# Altium schematic sheet 200_DC-DC.SchDoc: DC-DC Convertion stage
size A4; Date: xxxxxx; DrawnBy: J.A.Oviedo; Revision: R1V1; SheetNumber: 3; SheetTotal: 5
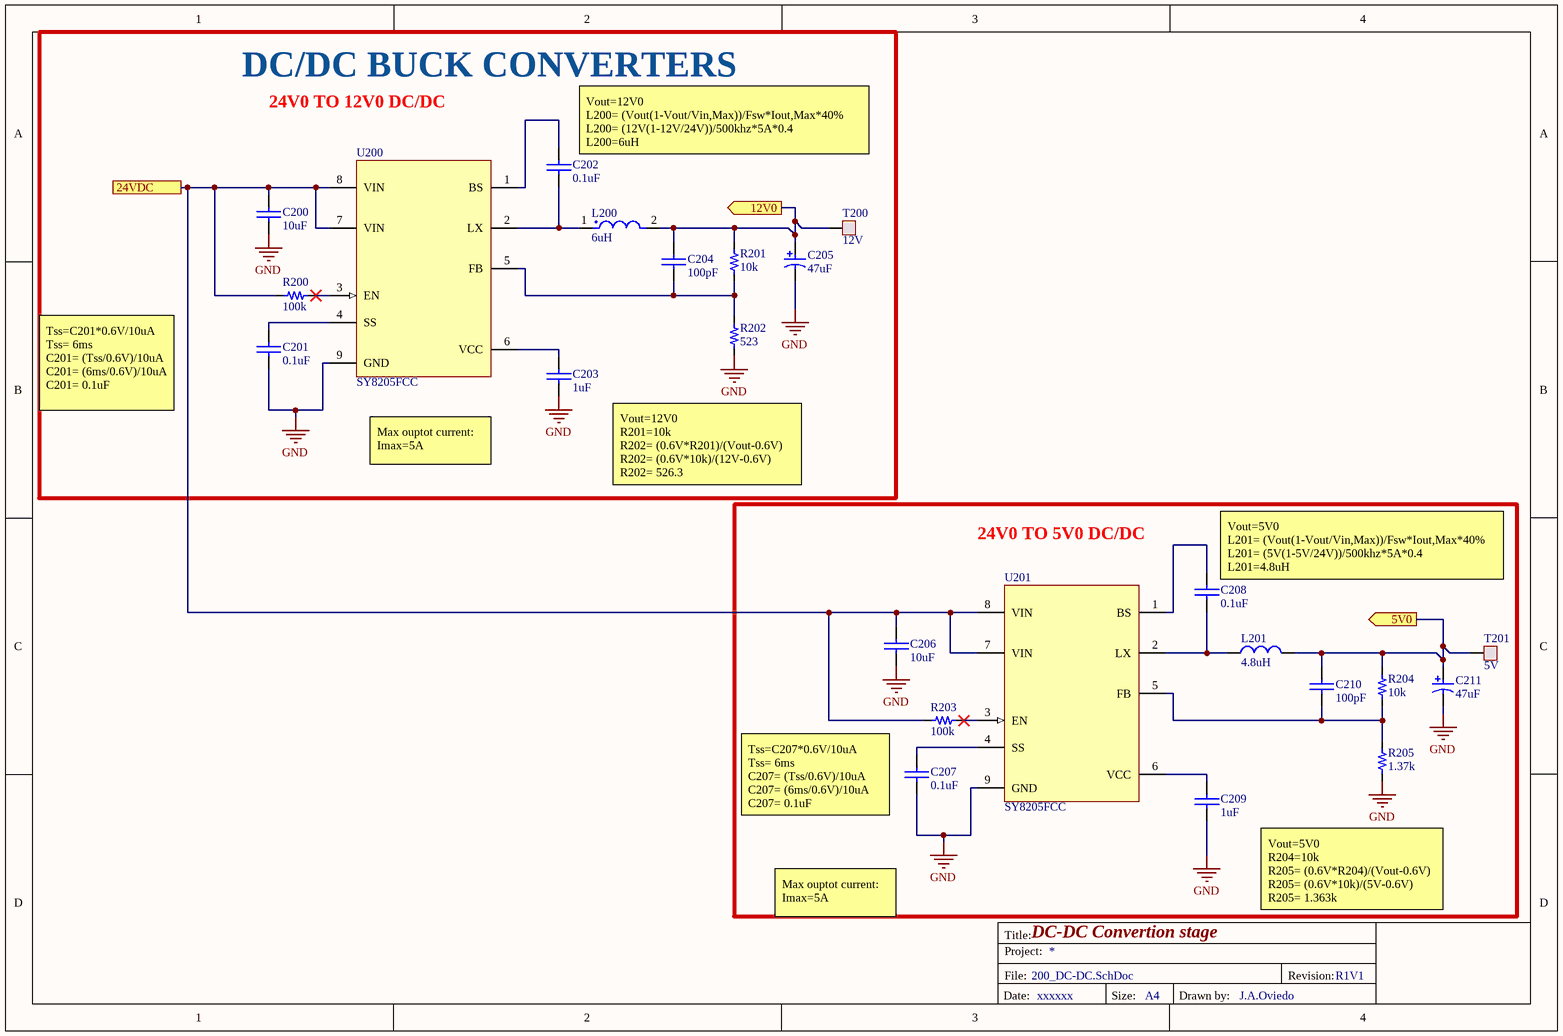
[diagram p0: 200_DC-DC.SchDoc]

## Parts
C200  value 10uF  [1206]  (hidden comment: 10uF 50V)
C201  value 0.1uF  [0603]  (hidden comment: 0.1uF 50V)
C202  value 0.1uF  [0603]  (hidden comment: 0.1uF 50V)
C203  value 1uF  [0805]  (hidden comment: 1uF 25V)
C204  value 100pF  [0201]  (hidden comment: 100pF 25V)
C205  value 47uF  [RADIAL-CAN_LSx2.54mm_Diax6.35mm]  (hidden comment: 47uF 25V)
C206  value 10uF  [1206]  (hidden comment: 10uF 50V)
C207  value 0.1uF  [0603]  (hidden comment: 0.1uF 50V)
C208  value 0.1uF  [0603]  (hidden comment: 0.1uF 50V)
C209  value 1uF  [0805]  (hidden comment: 1uF 25V)
C210  value 100pF  [0201]  (hidden comment: 100pF 25V)
C211  value 47uF  [RADIAL-CAN_LSx2.54mm_Diax6.35mm]  (hidden comment: 47uF 25V)
L200  value 6uH  [L_6uH_9.4A_CSCM1256]  (hidden comment: CSCM1256-6R0M)
L201  value 4.8uH  [L_4.8uH_11A_1312]  (hidden comment: 4.8uH_11A)
R200  value 100k  [0603]  (hidden comment: 100k 1/10W)
R201  value 10k  [0603]  (hidden comment: 10k 1/10W)
R202  value 523  [Res_523_0603_0.1W]  (hidden comment: 523_0.1W)
R203  value 100k  [0603]  (hidden comment: 100k 1/10W)
R204  value 10k  [0603]  (hidden comment: 10k 1/10W)
R205  value 1.37k  [Res_1.37k_0603_0.1W]  (hidden comment: 1.37k_0.1W)
T200  12V  [TP_SMD_45mil]  (no BOM)
T201  5V  [TP_SMD_45mil]  (no BOM)
U200  SY8205FCC  [SOIC127P600X160_HS-9N]
U201  SY8205FCC  [SOIC127P600X160_HS-9N]

## Blocks framed on the sheet
DC/DC BUCK CONVERTERS: C200-C205 L200 R200-R202 T200 U200
24V0 TO 5V0 DC/DC: C206-C211 L201 R203-R205 T201 U201

## Ports
5V0 (out, see 000_Hierarchical[4B], 400_DC-DC_Part3[3B]), 12V0 (out, see 000_Hierarchical[4A]), 24VDC (see 000_Hierarchical[3B], 100_AC-DC[4B], 300_DC-DC_Part2[1A], 400_DC-DC_Part3[1B])

## Nets
GND: C200.2 C201.2 C203.2 C205.2 C206.2 C207.2 C209.2 C211.2 R202.2 R205.1 U200.9(GND) U201.9(GND)
5V0: C210.1 C211.1 L201.2 R204.2 T201.1 ; port 5V0
12V0: C204.1 C205.1 L200.2 R201.2 T200.1 ; port 12V0
24VDC: C200.1 C206.1 R200.1 R203.1 U200.7(VIN) U200.8(VIN) U201.7(VIN) U201.8(VIN) ; port 24VDC
NetC201_1: C201.1 U200.4(SS)
NetC202_1: C202.1 U200.1(BS)
NetC202_2: C202.2 L200.1 U200.2(LX)
NetC203_1: C203.1 U200.6(VCC)
NetC204_2: C204.2 R201.1 R202.1 U200.5(FB)
NetC207_1: C207.1 U201.4(SS)
NetC208_1: C208.1 U201.1(BS)
NetC208_2: C208.2 L201.1 U201.2(LX)
NetC209_1: C209.1 U201.6(VCC)
NetC210_2: C210.2 R204.1 R205.2 U201.5(FB)
NetR200_2: R200.2 U200.3(EN)
NetR203_2: R203.2 U201.3(EN)

## Notes on the sheet
- 24V0 TO 12V0 DC/DC
- (near C202) Vout=12V0                                                                                   L200= (Vout(1-Vout/Vin,Max))/Fsw*Iout,Max*40%
  L200= (12V(1-12V/24V))/500khz*5A*0.4                L200=6uH
- Tss=C201*0.6V/10uA
  Tss= 6ms                     C201= (Tss/0.6V)/10uA        C201= (6ms/0.6V)/10uA       C201= 0.1uF
- Max ouptot current: Imax=5A
- Vout=12V0                                       R201=10k                                            R202= (0.6V*R201)/(Vout-0.6V)
  R202= (0.6V*10k)/(12V-0.6V)             R202= 526.3
- (near C208) Vout=5V0                                                                                   L201= (Vout(1-Vout/Vin,Max))/Fsw*Iout,Max*40%
  L201= (5V(1-5V/24V))/500khz*5A*0.4                L201=4.8uH
- (near C207) Tss=C207*0.6V/10uA
  Tss= 6ms                     C207= (Tss/0.6V)/10uA        C207= (6ms/0.6V)/10uA       C207= 0.1uF
- Vout=5V0                                       R204=10k                                            R205= (0.6V*R204)/(Vout-0.6V)
  R205= (0.6V*10k)/(5V-0.6V)             R205= 1.363k
- Title:
- Project:
- File:
- Revision:
- Date:
- Size:
- A4
- Drawn by:

## Library data of the parts
C200 C206 = Cap_10uF_1206_50V: CAP CER 10UF 50V X5R 1206; Manufacturer: Murata Electronics North America; Manufacturer Part Number: GRT31CR61H106ME01L; Last modified by: J.Jaramillo; Last modified date: 20240309; ComponentLink1Description: Digi-Key; ComponentLink1URL: https://www.digikey.com/product-detail/en/murata-electronics-north-america/GRT31CR61H106ME01L/490-12457-1-ND/5417158; Supplier 1: Digi-Key; Supplier Part Number 1: 490-12457-1-ND
C201 C202 C207 C208 = Cap_0.1uF_0603_50V: CAP CER 0.1UF 50V X7R 0603; Manufacturer: Samsung Electro-Mechanics; Manufacturer Part Number: CL10B104JB8NNNC; Supplier 1: Digi-Key; Supplier Part Number 1: 1276-1033-1-ND; Last modified by: J.Jaramillo; Last modified date: 20240309; ComponentLink1Description: Digi-key; ComponentLink1URL: https://www.digikey.com/en/products/detail/samsung-electro-mechanics/CL10B104JB8NNNC/3886691?s=N4IgTCBcDaIIxgOwDYC0cAMBmL7UDkAREAXQF8g
C203 C209 = Cap_1uF_0805_25V: CAP CER 1UF 25V X7R 0805; Manufacturer: Yageo; Manufacturer Part Number: CC0805KKX7R8BB105; Supplier 1: Digi-Key; Supplier Part Number 1: 311-1456-1-ND; Last modified by: J.Jaramillo; Last modified date: 20240309; ComponentLink1Description: Digi-Key; ComponentLink1URL: https://www.digikey.com/product-detail/en/yageo/CC0805KKX7R8BB105/311-1456-1-ND/2833762
C204 C210 = Cap_100pF_0201_25V: CAP CER 100PF 25V NP0 0201; Manufacturer: Murata Electronics; Manufacturer Part Number: GRM0335C1E101GA01D; Supplier 1: Digi-Key; Supplier Part Number 1: 490-17802-1-ND; Last modified by: J.Jaramillo; Last modified date: 20240309; ComponentLink1Description: Digi-Key; ComponentLink1URL: https://www.digikey.com/en/products/detail/murata-electronics/GRM0335C1E101GA01D/4358566?s=N4IgTCBcDaIOICUCyAGAzGgrAYQIwFFcVc4BBYgERAF0BfIA
C205 C211 = Cap_47uF_25V_ALU_THT: CAP 47uf/25V,10*16,105℃ RADIAL; Manufacturer: SamXon; Manufacturer Part Number: KM 47U/25V; Last modified by: J.Jaramillo; Last modified date: 20240309; Supplier 1: Poshton; Supplier Part Number 1: KM 47U/25V; ComponentLink1Description: Datasheet; ComponentLink1URL: CMP000351_KM-Series
L200 = L_6uH_9.4A_CSCM1256: FIXED IND 6UH 9.4A 6.27 MOHM SMD; Manufacturer: CODACA; Manufacturer Part Number: CSCM1256-6R0M; Supplier 1: Digi-key; Supplier Part Number 1: 4044-CSCM1256-6R0MCT-ND; Reel Stock: N/A; Last modified by: J.A.Oviedo; Last modified date: 20261019
L201 = L_4.8uH_11A_1312: 11A 4.8uH ±20% 11.55mΩ 13A Molded inductor SMD,13x12.8mm Fixed Inductors; Manufacturer: Coilank; Manufacturer Part Number: APZBX1250M4R8; Supplier 1: LCSC; Supplier Part Number 1: C54623473; Reel Stock: N/A; Last modified by: J.A.Oviedo; Last modified date: 20261020
R200 R203 = Res_100k_0603_1/10W: RES 100k OHM 1% 1/10W 0603; Manufacturer: Stackpole Electronics Inc.; Manufacturer Part Number: RMCF0603FT100K; Supplier 1: Digi-Key; Supplier Part Number 1: RMCF0603FT100KCT-ND; Reel Stock: N/A; Last modified by: J.Jaramillo; Last modified date: 20240310; ComponentLink1Description: Digi-Key; ComponentLink1URL: https://www.digikey.com/product-detail/en/stackpole-electronics-inc/RMCF0603FT100K/RMCF0603FT100KCT-ND/1943118
R201 R204 = Res_10k_0603_1/10W: RES SMD 10K OHM 1% 1/10W 0603; Manufacturer: Samsung Electro-Mechanics; Manufacturer Part Number: RC1608F103CS; ComponentLink1URL: https://www.digikey.com/products/en?keywords=1276-3485-1-ND; Supplier 1: Digi-Key; Supplier Part Number 1: 1276-3485-1-ND; Reel Stock: N/A; Last modified by: J.Jaramillo; Last modified date: 20240310; ComponentLink1Description: Digi-key
R202 = Res_523_0603_0.1W: RES 523 OHM 1% 1/10W 0603; Manufacturer: YAGEO; Manufacturer Part Number: RC0603FR-07523RL; Supplier 1: Digi-key; Supplier Part Number 1: 311-523HRCT-ND; Reel Stock: N/A; Last modified by: J.A.Oviedo; Last modified date: 20261016
R205 = Res_1.37k_0603_0.1W: Fixed Resistor, Metal Glaze/thick Film, 0.1W, 1370ohm, 75V, 1% +/-Tol, 100ppm/Cel, Surface Mount, 0603; Power Rating: 100mW; Temperature Coefficient: 100ppm/°C; Reel Stock: N/A; Last modified by: J.A.Oviedo; Last modified date: 20261020; ComponentLink1Description: New link; ComponentLink1URL: *; Supplier: Mouser; Supplier Part Number: 603-AF0603FR-071K37L; RoHS: Compliant; Category: Chip SMD Resistors; Stock: 7115; Pricing: 1=0,1, 10=0,022, 50=0,022, 100=0,016, 1000=0,012, 10000=0,008 (USD); Case/Package: 0603; China RoHS: Non-Compliant; Composition: Thick Film; Country of Origin: Mainland China, Taiwan; Export Control Classification Number (ECCN) Code: EAR99; Height: 450µm; Harmonized Tariff Schedule (HTS) Code: 8533.21.00.30; Introduction Date: 2012-05-08; Length: 1.6mm; Lifecycle Status: Production; Max Operating Temperature: 155°C; Min Operating Temperature: -55°C; Mounting Technology: Surface Mount; Number of Terminals: 2; Packaging: Tape & Reel; Ratings: AEC-Q200; REACH SVHC: Unaffected; Tolerance: 1%; Voltage Rating: 75V; Width: 800µm; Working Voltage: 75V; ComponentLink2URL: https://datasheet.octopart.com:443/AF0603FR-071K37L-Yageo-datasheet-182189395.pdf?src-supplier=IHS; ComponentLink2Description: https://datasheet.octopart.com:443/AF0603FR-071K37L-Yageo-datasheet-182189395.pdf?src-supplier=IHS; ComponentLink3URL: https://datasheet.octopart.com:443/AF0603FR-071K37L-Yageo-datasheet-153645569.pdf?src-supplier=Upverter; ComponentLink3Description: https://datasheet.octopart.com:443/AF0603FR-071K37L-Yageo-datasheet-153645569.pdf?src-supplier=Upverter; ComponentLink4URL: https://sigma.octopart.com:443/138820526/technical_drawing/Yageo-AF0603FR-071K37L.pdf?src-supplier=Upverter; ComponentLink4Description: https://sigma.octopart.com:443/138820526/technical_drawing/Yageo-AF0603FR-071K37L.pdf?src-supplier=Upverter; ComponentLink5URL: https://datasheet.octopart.com/AF0603FR-071K37L-Yageo-datasheet-68296209.pdf; ComponentLink5Description: https://datasheet.octopart.com/AF0603FR-071K37L-Yageo-datasheet-68296209.pdf; ComponentLink6URL: http://sigma.octopart.com:80/conflict_mineral_statement/Yageo-company-3.pdf?src-supplier=Compliance+Statements; ComponentLink6Description: http://sigma.octopart.com:80/conflict_mineral_statement/Yageo-company-3.pdf?src-supplier=Compliance+Statements; ComponentLink7URL: http://sigma.octopart.com:80/rohs_statement/Yageo-company-2.pdf?src-supplier=Compliance+Statements; ComponentLink7Description: http://sigma.octopart.com:80/rohs_statement/Yageo-company-2.pdf?src-supplier=Compliance+Statements; Supplier 1: Mouser; Supplier Part Number 1: 603-AF0603FR-071K37L
T200 T201 = TP_SMD_45mil: Test point 45mil pad size; Last modified by: J.Jaramillo; Last modified date: 20240310
U200 U201 = DC/DC_ADJ_5A_SOIC-8-EP: High Efficiency Fast Response, 5A, 30V Input Synchronous Step Down Regulator; Manufacturer: Silergy; Manufacturer Part Number: SY8205FCC; Supplier 1: LCSC; Supplier Part Number 1: C111875; Reel Stock: N/A; Last modified by: J.A.OVIEDO; Last modified date: 20261018; ComponentLink1Description: LCSC; ComponentLink1URL: https://www.lcsc.com/es/product-detail/C111875.html?s_z=n_q_SY8205FCC; ComponentLink2Description: DATASHEET; ComponentLink2URL: https://www.lcsc.com/datasheet/C111875.pdf